# EasyEDA Pro project H7MS-H735-R4B.epro, board H7MS_CORE_H735_A1_核心板PCB
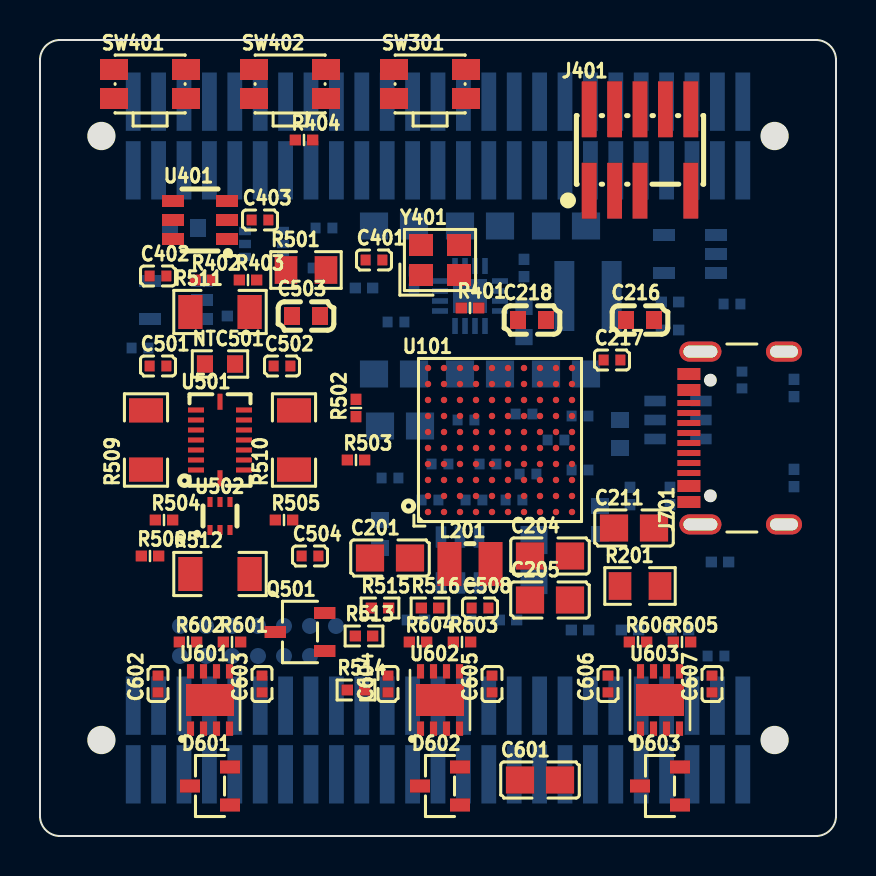
[diagram p11: board, top side]
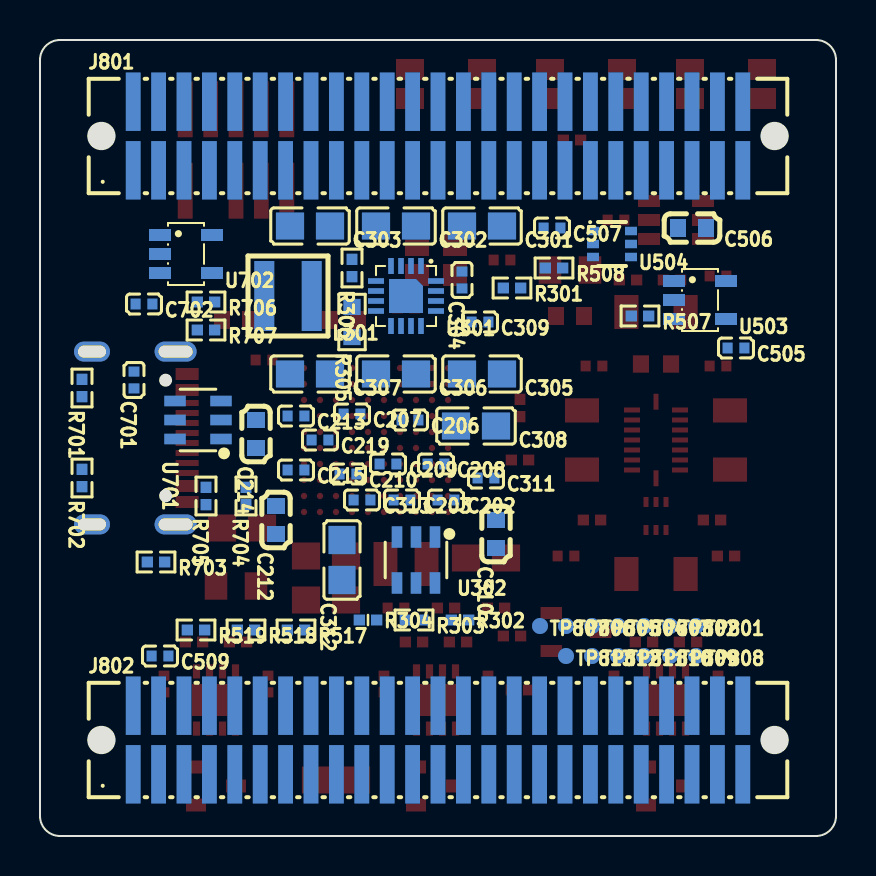
[diagram p12: board, bottom side, seen from below]

Outline 39.8 x 39.8 mm; copper layers: Top Layer, Inner1, Inner2, Inner3, Inner4, Bottom Layer. Coordinates in mm from the lower left corner of the outline.
Outline path: 0,38.8 arc(0.29,39.51) 1,39.8 38.8,39.8 arc(39.51,39.51) 39.8,38.8 39.8,1 arc(39.51,0.29) 38.8,0 1,0 arc(0.29,0.29) 0,1 0,38.8
Stack: Top Layer 0.035mm / Dielectric1 1.51mm FR4 er 4.5 / Bottom Layer 0.035mm

## Design rules (mm)
spacing copperThickness1oz (default): track to track 0.102, other pairs 0.152 to 0.3
spacing copperThickness2oz: track to track 0.203, other pairs 0.152 to 0.3
track width copperThickness1oz (default): min 0.127, default 0.152, max 2.54
track width copperThickness2oz: min 0.203, default 0.254, max 2.54
differential pair differentialPair (default): width min 0.127, default 0.254, max 2.54; gap min 0.152, default 0.152

## Placement (name value [footprint] x y rotation side)
C201  10uF  [C0805]  17.5 13.9 0 top
C202  100nF  [C0402]  19.5 16.8 0 bottom
C203  220pF  [C0402]  21.7 16.8 0 bottom
C204  10uF  [C0805]  25.5 14 0 top
C205  10uF  [C0805]  25.5 11.8 0 top
C206  100nF  [C0402]  21.3 20.8 0 bottom
C207  100nF  [C0402]  24.2 21.1 0 bottom
C208  100nF  [C0402]  20 18.6 0 bottom
C209  100nF  [C0402]  22.4 18.6 0 bottom
C210  100nF  [C0402]  24.4 18.1 0 bottom
C211  10uF  [C0805]  29.7 15.4 0 top
C212  1uF  [C0603]  28 15.8 90 bottom
C213  100nF  [C0402]  27 21 0 bottom
C214  1uF  [C0603]  29 20.1 90 bottom
C215  100nF  [C0402]  27 18.3 0 bottom
C216  1uF  [C0603]  30 25.8 0 top
C217  100nF  [C0402]  28.6 23.8 0 top
C218  1uF  [C0603]  24.6 25.8 0 top
C219  100nF  [C0402]  25.8 19.8 0 bottom
C301  10uF  [C0805]  17.7 30.5 0 bottom
C302  10uF  [C0805]  22 30.5 0 bottom
C303  10uF  [C0805]  26.3 30.5 0 bottom
C304  100nF  [C0402]  18.7 27.8 90 bottom
C305  10uF  [C0805]  17.7 23.1 0 bottom
C306  10uF  [C0805]  22 23.1 0 bottom
C307  10uF  [C0805]  26.3 23.1 0 bottom
C308  10uF  [C0805]  18 20.5 0 bottom
C309  10nF  [C0402]  17.8 25.7 0 bottom
C310  1uF  [C0603]  17 15.1 90 bottom
C311  100nF  [C0402]  17.5 17.9 0 bottom
C312  10uF  [C0805]  24.7 13.8 90 bottom
C313  100nF  [C0402]  23.7 16.8 0 bottom
C401  100nF  [C0402]  16.7 28.8 0 top
C402  100nF  [C0402]  5.9 28 0 top
C403  100nF  [C0402]  11 30.8 0 top
C501  100nF  [C0402]  5.9 23.5 0 top
C502  100nF  [C0402]  12.1 23.5 0 top
C503  1uF  [C0603]  13.3 26 0 top
C504  100nF  [C0402]  13.5 14 0 top
C505  100nF  [C0402]  5 24.4 0 bottom
C506  1uF  [C0603]  7.2 30.4 0 bottom
C507  100nF  [C0402]  14.2 30.4 0 bottom
C508  10nF  [C0402]  22 11.4 0 top
C509  10nF  [C0402]  33.8 9 0 bottom
C601  10uF  [C0805]  25 2.8 0 top
C602  100nF  [C0402]  5.9 7.6 90 top
C603  100nF  [C0402]  11.1 7.6 90 top
C604  100nF  [C0402]  17.4 7.6 90 top
C605  100nF  [C0402]  22.6 7.6 90 top
C606  100nF  [C0402]  28.4 7.6 90 top
C607  100nF  [C0402]  33.6 7.6 90 top
C701  100nF  [C0402]  35.1 22.8 90 bottom
C702  100nF  [C0402]  34.6 26.6 0 bottom
D601  PESD2CANFD24V-TR  [SOT-23-3_L2.9-W1.3-P1.90-LS2.4-BR]  8.5 2.5 0 top
D602  PESD2CANFD24V-TR  [SOT-23-3_L2.9-W1.3-P1.90-LS2.4-BR]  20 2.5 0 top
D603  PESD2CANFD24V-TR  [SOT-23-3_L2.9-W1.3-P1.90-LS2.4-BR]  31 2.5 0 top
J401  FTSH-105-01-L-DV-007-K  [HDR-SMD_9P-P1.27_FTSH-105-01-L-DV-007-K]  30 34.3 0 top
J701  USB4145-03-0070-C  [H7MS_USB4105_GF_A_120_B4_R3]  32.44 19.9 90 top
J801  TFM-115-02-L-D-A  [CONN-SMD_50P-P1.27_TFM-125-02-L-D-A]  19.9 35 180 bottom
J802  TFM-115-02-L-D-A  [CONN-SMD_50P-P1.27_TFM-125-02-L-D-A]  19.9 4.8 180 bottom
L201  2.2uH  [IND-SMD_L2.5-W2.0-1]  21.5 13.6 0 top
L301  2.2uH  [IND-SMD_L4.0-W4.0_XAL4030-332MEC]  27.4 27 0 bottom
NTC501  NTCG163JF103FT1  [R0603]  9 23.6 0 top
Q501  DMN2056U-7  [SOT-23-3_L2.9-W1.6-P1.90-LS2.8-BR]  13 10.2 0 top
R201  0Ω  [R0805]  30 12.5 0 top
R301  100kΩ  [R0402]  16.2 27.4 0 bottom
R302  10kΩ  [R0402]  18.8 10.8 0 bottom
R303  45.3kΩ  [R0402]  21.1 10.8 0 bottom
R304  10kΩ  [R0402]  23.4 10.8 0 bottom
R305  312kΩ  [R0603]  24.2 25.7 90 bottom
R306  100kΩ  [R0402]  24.2 28.4 90 bottom
R401  22Ω  [R0402]  21.5 26.4 0 top
R402  10kΩ  [R0402]  8.2 27.8 0 top
R403  10kΩ  [R0402]  10.4 27.8 0 top
R404  10kΩ  [R0402]  13.2 34.8 0 top
R501  0Ω  [R0805]  13.3 28.3 0 top
R502  22Ω  [R0402]  15.8 21.4 90 top
R503  22Ω  [R0402]  15.8 18.8 0 top
R504  10kΩ  [R0402]  6.2 15.8 0 top
R505  10kΩ  [R0402]  12.2 15.8 0 top
R506  10kΩ  [R0402]  5.5 14 0 top
R507  100kΩ  [R0402]  9.8 26 0 bottom
R508  1kΩ  [R0402]  14.1 28.4 0 bottom
R509  200Ω  [R1206]  5.3 19.8 90 top
R510  200Ω  [R1206]  12.7 19.8 90 top
R511  200Ω  [R1206]  9 26.2 0 top
R512  200Ω  [R1206]  9 13.1 0 top
R513  100Ω  [R0402]  16.2 10 0 top
R514  100kΩ  [R0402]  15.8 7.3 0 top
R515  10kΩ  [R0402]  17 11.4 0 top
R516  1kΩ  [R0402]  19.5 11.4 0 top
R517  20kΩ  [R0402]  27 10.3 0 bottom
R518  10kΩ  [R0402]  29.5 10.3 0 bottom
R519  1kΩ  [R0402]  32 10.3 0 bottom
R601  10kΩ  [R0402]  9.6 9.7 0 top
R602  10kΩ  [R0402]  7.4 9.7 0 top
R603  10kΩ  [R0402]  21.1 9.7 0 top
R604  10kΩ  [R0402]  18.9 9.7 0 top
R605  10kΩ  [R0402]  32.1 9.7 0 top
R606  10kΩ  [R0402]  29.9 9.7 0 top
R701  5.1kΩ  [R0402]  37.7 22.4 90 bottom
R702  5.1kΩ  [R0402]  37.7 17.9 90 bottom
R703  0Ω  [R0402]  34 13.7 0 bottom
R704  0Ω  [R0402]  29.5 17 90 bottom
R705  0Ω  [R0402]  31.5 17 90 bottom
R706  1kΩ  [R0402]  31.5 26.7 0 bottom
R707  100kΩ  [R0402]  31.5 25.3 0 bottom
SW301  EVQP7A01P  [H7MS_EVQP7A01P_1234]  19.5 37.6 0 top
SW401  EVQP7A01P  [H7MS_EVQP7A01P_1234]  5.5 37.6 0 top
SW402  EVQP7A01P  [H7MS_EVQP7A01P_1234]  12.5 37.6 0 top
TP801  PCB_TP_0.8  [H7MS_TP_0p8_NOMASKPASTE]  7 10.5 0 bottom
TP802  PCB_TP_0.8  [H7MS_TP_0p8_NOMASKPASTE]  8.3 10.5 0 bottom
TP803  PCB_TP_0.8  [H7MS_TP_0p8_NOMASKPASTE]  9.6 10.5 0 bottom
TP804  PCB_TP_0.8  [H7MS_TP_0p8_NOMASKPASTE]  10.9 10.5 0 bottom
TP805  PCB_TP_0.8  [H7MS_TP_0p8_NOMASKPASTE]  12.2 10.5 0 bottom
TP806  PCB_TP_0.8  [H7MS_TP_0p8_NOMASKPASTE]  13.5 10.5 0 bottom
TP807  PCB_TP_0.8  [H7MS_TP_0p8_NOMASKPASTE]  14.8 10.5 0 bottom
TP808  PCB_TP_0.8  [H7MS_TP_0p8_NOMASKPASTE]  7 9 0 bottom
TP809  PCB_TP_0.8  [H7MS_TP_0p8_NOMASKPASTE]  8.3 9 0 bottom
TP810  PCB_TP_0.8  [H7MS_TP_0p8_NOMASKPASTE]  9.6 9 0 bottom
TP811  PCB_TP_0.8  [H7MS_TP_0p8_NOMASKPASTE]  10.9 9 0 bottom
TP812  PCB_TP_0.8  [H7MS_TP_0p8_NOMASKPASTE]  12.2 9 0 bottom
TP813  PCB_TP_0.8  [H7MS_TP_0p8_NOMASKPASTE]  13.5 9 0 bottom
U101  STM32H735VGH6  [BGA-100_L8.0-W8.0-P0.80-R10-C10-BL]  23 19.8 0 top
U301  TPS62130ARGTR  [VQFN-16_L3.0-W3.0-P0.50-BL-EP1.7]  21.5 27 0 bottom
U302  TPS2553DBVR-1  [SOT-23-6_L2.9-W1.6-P0.95-LS2.8-BL]  21 13.8 0 bottom
U401  TPS3808G33DBVR  [SOT-23-6_L2.9-W1.6-P0.95-LS2.8-BR]  8 30.8 0 top
U501  BMI088  [LGA-16_L4.5-W3.0-P0.50-BL]  9 19.8 0 top
U502  TMP302ADRLR  [SOT-5X3-6_W1.6-L1.2-P0.50-LS1.6-BL]  9 16 0 top
U503  SN74LVC1G08DBVR  [SOT-23-5_L3.0-W1.7-P0.95-LS2.8-BR]  6.8 26.8 0 bottom
U504  TPS22919DCKR  [SC-70-6_L2.2-W1.3-P0.65-LS2.1-BR]  11.2 29.6 0 bottom
U601  TCAN1042HGVDRBRQ1  [HVSON-8_L3.0-W3.0-P0.65-BL-EP]  8.5 6.8 0 top
U602  TCAN1042HGVDRBRQ1  [HVSON-8_L3.0-W3.0-P0.65-BL-EP]  20 6.8 0 top
U603  TCAN1042HGVDRBRQ1  [HVSON-8_L3.0-W3.0-P0.65-BL-EP]  31 6.8 0 top
U701  USBLC6-2SC6  [SOT-23-6_L2.9-W1.6-P0.95-LS2.8-BL]  31.9 20.8 90 bottom
U702  SN74LVC1G17DBVR  [SOT-23-5_L3.0-W1.7-P0.95-LS2.8-BR]  32.5 29.1 0 bottom
Y401  X1G0041710015  [OSC-SMD_4P-L2.5-W2.0-BL]  20 28.8 0 top

## Footprints (pads in the part's own frame, mm; a bottom-side part is the same pattern mirrored in y, then rotated)
BGA-100_L8.0-W8.0-P0.80-R10-C10-BL
  round 0.32 smd: A1(-3.6,-3.6) A2(-3.6,-2.8) A3(-3.6,-2) A4(-3.6,-1.2) A5(-3.6,-0.4) A6(-3.6,0.4) A7(-3.6,1.2) A8(-3.6,2) A9(-3.6,2.8) A10(-3.6,3.6) B1(-2.8,-3.6) B2(-2.8,-2.8) B3(-2.8,-2) B4(-2.8,-1.2) B5(-2.8,-0.4) B6(-2.8,0.4) B7(-2.8,1.2) B8(-2.8,2) B9(-2.8,2.8) B10(-2.8,3.6) C1(-2,-3.6) C2(-2,-2.8) C3(-2,-2) C4(-2,-1.2) C5(-2,-0.4) C6(-2,0.4) C7(-2,1.2) C8(-2,2) C9(-2,2.8) C10(-2,3.6) D1(-1.2,-3.6) D2(-1.2,-2.8) D3(-1.2,-2) D4(-1.2,-1.2) D5(-1.2,-0.4) D6(-1.2,0.4) D7(-1.2,1.2) D8(-1.2,2) D9(-1.2,2.8) D10(-1.2,3.6) E1(-0.4,-3.6) E2(-0.4,-2.8) E3(-0.4,-2) E4(-0.4,-1.2) E5(-0.4,-0.4) E6(-0.4,0.4) E7(-0.4,1.2) E8(-0.4,2) E9(-0.4,2.8) E10(-0.4,3.6) F1(0.4,-3.6) F2(0.4,-2.8) F3(0.4,-2) F4(0.4,-1.2) F5(0.4,-0.4) F6(0.4,0.4) F7(0.4,1.2) F8(0.4,2) F9(0.4,2.8) F10(0.4,3.6) G1(1.2,-3.6) G2(1.2,-2.8) G3(1.2,-2) G4(1.2,-1.2) G5(1.2,-0.4) G6(1.2,0.4) G7(1.2,1.2) G8(1.2,2) G9(1.2,2.8) G10(1.2,3.6) H1(2,-3.6) H2(2,-2.8) H3(2,-2) H4(2,-1.2) H5(2,-0.4) H6(2,0.4) H7(2,1.2) H8(2,2) H9(2,2.8) H10(2,3.6) J1(2.8,-3.6) J2(2.8,-2.8) J3(2.8,-2) J4(2.8,-1.2) J5(2.8,-0.4) J6(2.8,0.4) J7(2.8,1.2) J8(2.8,2) J9(2.8,2.8) J10(2.8,3.6) K1(3.6,-3.6) K2(3.6,-2.8) K3(3.6,-2) K4(3.6,-1.2) K5(3.6,-0.4) K6(3.6,0.4) K7(3.6,1.2) K8(3.6,2) K9(3.6,2.8) K10(3.6,3.6)
C0402
  rect 0.5x0.54 smd: 1(-0.42,0) 2(0.42,0)
C0603
  rect 0.8x0.9 smd: 1(-0.7,0) 2(0.7,0)
C0805
  rect 1.41x1.35 smd: 1(-1,0) 2(1,0)
CONN-SMD_50P-P1.27_TFM-125-02-L-D-A
  rect 0.74x2.92 smd: 1(-15.24,-1.715) 2(-15.24,1.715) 3(-13.97,-1.715) 4(-13.97,1.715) 5(-12.7,-1.715) 6(-12.7,1.715) 7(-11.43,-1.715) 8(-11.43,1.715) 9(-10.16,-1.715) 10(-10.16,1.715) 11(-8.89,-1.715) 12(-8.89,1.715) 13(-7.62,-1.715) 14(-7.62,1.715) 15(-6.35,-1.715) 16(-6.35,1.715) 17(-5.08,-1.715) 18(-5.08,1.715) 19(-3.81,-1.715) 20(-3.81,1.715) 21(-2.54,-1.715) 22(-2.54,1.715) 23(-1.27,-1.715) 24(-1.27,1.715) 25(0,-1.715) 26(0,1.715) 27(1.27,-1.715) 28(1.27,1.715) 29(2.54,-1.715) 30(2.54,1.715) 31(3.81,-1.715) 32(3.81,1.715) 33(5.08,-1.715) 34(5.08,1.715) 35(6.35,-1.715) 36(6.35,1.715) 37(7.62,-1.715) 38(7.62,1.715) 39(8.89,-1.715) 40(8.89,1.715) 41(10.16,-1.715) 42(10.16,1.715) 43(11.43,-1.715) 44(11.43,1.715) 45(12.7,-1.715) 46(12.7,1.715) 47(13.97,-1.715) 48(13.97,1.715) 49(15.24,-1.715) 50(15.24,1.715)
H7MS_EVQP7A01P_1234
  rect 1.4x1.05 smd: 1(-1.8,0.725) 2(-1.8,-0.725) 3(1.8,0.725) 4(1.8,-0.725)
H7MS_TP_0p8_NOMASKPASTE
  round 0.8 smd: 1(0,0)
H7MS_USB4105_GF_A_120_B4_R3
  oval 1x2.1 hole 0.6x1.7: 1(-4.32,-0.575) 4(4.32,-0.575)
  oval 1x1.8 hole 0.6x1.4: 2(-4.32,-4.755) 3(4.32,-4.755)
  rect 0.6x1.15 smd: A1-B12(-3.2,0) A4-B9(-2.4,0) B1-A12(3.2,0) B4-A9(2.4,0)
  rect 0.3x1.15 smd: A5(-1.25,0) A6(-0.25,0) A7(0.25,0) A8(1.75,0) B5(1.25,0) B6(0.75,0) B7(-0.75,0) B8(-1.75,0)
HDR-SMD_9P-P1.27_FTSH-105-01-L-DV-007-K
  rect 0.74x2.79 smd: 1(-2.54,-2.035) 2(-2.54,2.035) 3(-1.27,-2.035) 4(-1.27,2.035) 5(0,-2.035) 6(0,2.035) 8(1.27,2.035) 9(2.54,-2.035) 10(2.54,2.035)
HVSON-8_L3.0-W3.0-P0.65-BL-EP
  rect 0.355x0.711 smd: 1(-0.975,-1.433) 2(-0.325,-1.433) 3(0.325,-1.433) 4(0.975,-1.433) 5(0.975,1.433) 6(0.325,1.433) 7(-0.325,1.433) 8(-0.975,1.433)
  rect 2.4x1.6 smd: 9(0,0)
IND-SMD_L2.5-W2.0-1
  rect 1.2x2.2 smd: 1(1.028,0) 2(-1.028,0)
IND-SMD_L4.0-W4.0_XAL4030-332MEC
  rect 1x3.5 smd: 1(-1.185,0) 2(1.185,0)
LGA-16_L4.5-W3.0-P0.50-BL
  rect 0.8x0.25 smd: 1(-1.2,-1.498) 2(-1.2,-0.998) 3(-1.2,-0.498) 4(-1.2,0.002) 5(-1.2,0.502) 6(-1.2,1.002) 7(-1.2,1.502) 9(1.2,1.502) 10(1.2,1.002) 11(1.2,0.502) 12(1.2,0.002) 13(1.2,-0.498) 14(1.2,-0.998) 15(1.2,-1.498)
  rect 0.25x0.8 smd: 8(0,1.915) 16(0,-1.915)
OSC-SMD_4P-L2.5-W2.0-BL
  rect 1.2x1.1 smd: 1(-0.95,-0.75) 2(0.95,-0.75) 3(0.95,0.75) 4(-0.95,0.75)
R0402
  rect 0.566x0.54 smd: 1(-0.433,0) 2(0.433,0)
R0603
  rect 0.806x0.864 smd: 1(-0.753,0) 2(0.753,0)
R0805
  rect 1.133x1.377 smd: 1(-1,0) 2(1,0)
R1206
  rect 1.208x1.701 smd: 1(-1.479,0) 2(1.479,0)
SC-70-6_L2.2-W1.3-P0.65-LS2.1-BR
  rect 0.6x0.42 smd: 1(0.95,-0.65) 2(0.95,0) 3(0.95,0.65) 4(-0.95,0.65) 5(-0.95,0) 6(-0.95,-0.65)
SOT-5X3-6_W1.6-L1.2-P0.50-LS1.6-BL
  rect 0.25x0.5 smd: 1(-0.501,-0.7) 2(-0.001,-0.7) 3(0.499,-0.7) 4(0.501,0.7) 5(-0.001,0.7) 6(-0.501,0.7)
SOT-23-3_L2.9-W1.3-P1.90-LS2.4-BR
  rect 1x0.65 smd: 1(1,-0.95) 2(1,0.95) 3(-1,0)
SOT-23-3_L2.9-W1.6-P1.90-LS2.8-BR
  rect 1.07x0.6 smd: 1(1.235,-0.95) 2(1.235,0.95) 3(-1.235,0)
SOT-23-5_L3.0-W1.7-P0.95-LS2.8-BR
  rect 1.1x0.6 smd: 1(1.3,-0.95) 2(1.3,0) 3(1.3,0.95) 4(-1.3,0.95) 5(-1.3,-0.95)
SOT-23-6_L2.9-W1.6-P0.95-LS2.8-BL
  rect 0.532x1.072 smd: 1(-0.95,-1.149) 2(0,-1.149) 3(0.95,-1.149) 4(0.95,1.149) 5(0,1.149) 6(-0.95,1.149)
SOT-23-6_L2.9-W1.6-P0.95-LS2.8-BR
  rect 1.1x0.6 smd: 1(1.35,-0.95) 2(1.35,0) 3(1.35,0.95) 4(-1.35,0.95) 5(-1.35,0) 6(-1.35,-0.95)
VQFN-16_L3.0-W3.0-P0.50-BL-EP1.7
  rect 0.28x0.8 smd: 1(-0.749,-1.5) 2(-0.249,-1.5) 3(0.249,-1.5) 4(0.75,-1.5) 9(0.75,1.5) 10(0.249,1.5) 11(-0.249,1.5) 12(-0.749,1.5)
  rect 0.8x0.28 smd: 5(1.5,-0.749) 6(1.5,-0.249) 7(1.5,0.249) 8(1.5,0.75) 13(-1.5,0.75) 14(-1.5,0.249) 15(-1.5,-0.249) 16(-1.5,-0.749)
  custom 1.7x1.7 smd: 17(0,0)

## Nets
3V3_A: C212.1 C213.1 C214.1 C215.1 R201.2 R515.1 TP803.1 U101.H1 U101.J1
3V3_AUX: C312.1 C313.1 J801.22 J801.24 TP804.1 U302.6
3V3_D: C201.1 C202.1 C208.1 C209.1 C210.1 C211.1 C216.1 C217.1 C218.1 C219.1 C305.1 C306.1 C307.1 C308.1 C310.1 C311.1 C401.1 C402.1 C504.1 C505.1 C603.1 C605.1 C607.1 C702.1 J401.1 L301.2 R201.1 R301.2 R302.2 R304.2 R305.1 R402.2 R403.2 R501.1 R506.2 R601.2 R602.2 R603.2 R604.2 R605.2 R606.2 SW402.2 SW402.4 TP802.1 U101.C2 U101.D3 U101.D6 U101.E1 U101.E5 U101.E8 U101.F6 U301.14 U302.1 U401.5 U401.6 U502.4 U502.5 U502.6 U503.5 U601.5 U602.5 U603.5 U702.5 Y401.1 Y401.4
3V3_IMU: C501.1 C502.1 C503.1 R501.2 R504.2 R505.2 U501.3 U501.11
5V_IN: C301.1 C302.1 C303.1 C304.1 C506.1 C601.1 C602.1 C604.1 C606.1 J801.10 J801.12 J801.14 J801.16 J801.18 J801.20 R517.1 TP801.1 U301.10 U301.11 U301.12 U301.13 U504.1 U601.3 U602.3 U603.3
GND: C201.2 C202.2 C203.2 C204.2 C205.2 C206.2 C207.2 C208.2 C209.2 C210.2 C211.2 C212.2 C213.2 C214.2 C215.2 C216.2 C217.2 C218.2 C219.2 C301.2 C302.2 C303.2 C304.2 C305.2 C306.2 C307.2 C308.2 C309.2 C310.2 C311.2 C312.2 C313.2 C401.2 C402.2 C403.2 C501.2 C502.2 C503.2 C504.2 C505.2 C506.2 C507.2 C508.2 C509.2 C601.2 C602.2 C603.2 C604.2 C605.2 C606.2 C607.2 C701.2 C702.2 D601.3 D602.3 D603.3 J401.3 J401.5 J401.9 J701.A1-B12 J701.B1-A12 J801.3 J801.6 J801.9 J801.11 J801.13 J801.15 J801.17 J801.19 J801.21 J801.23 J801.25 J801.28 J801.31 J801.34 J801.37 J801.40 J801.43 J801.46 J801.49 J802.2 J802.5 J802.8 J802.11 J802.14 J802.17 J802.20 J802.23 J802.26 J802.29 J802.32 J802.35 J802.38 J802.41 J802.44 J802.47 J802.49 J802.50 NTC501.2 Q501.2 R303.2 R306.2 R404.2 R507.2 R514.2 R518.2 R701.2 R702.2 R703.2 R707.2 SW301.2 SW301.4 SW401.2 SW401.4 TP806.1 U101.C1 U101.D1 U101.D5 U101.E7 U101.F5 U101.H2 U301.6 U301.7 U301.8 U301.15 U301.16 U301.17 U302.2 U401.2 U501.2 U501.4 U501.6 U501.7 U502.1 U502.2 U503.3 U504.2 U601.2 U601.9 U602.2 U602.9 U603.2 U603.9 U701.2 U702.3 Y401.2
V5_NODE: R517.2 R518.1 R519.1
VBUS_PRESENT: U101.E9 U702.4
VBUS_SENSE: R706.2 R707.1 U702.2
AUX_EN: R302.1 SW301.1 SW301.3 U302.3
AUX_FAULT_N: R304.1 TP812.1 U302.4
AUX_ILIM: R303.1 U302.5
BOOT0: R404.1 SW402.1 SW402.3 TP808.1 U101.A5
BUCK_FB: R305.2 R306.1 U301.5
BUCK_PG: R301.1 TP813.1 U301.4
BUCK_SS: C309.1 U301.9
BUCK_SW: L301.1 U301.1 U301.2 U301.3
CAN1_H: D601.2 J801.1 U601.7
CAN1_L: D601.1 J801.2 U601.6
CAN1_RX: U101.A4 U601.4
CAN1_STB: R601.1 U101.A8 U601.8
CAN1_TX: R602.1 U101.E3 U601.1
CAN2_H: D602.2 J801.4 U602.7
CAN2_L: D602.1 J801.5 U602.6
CAN2_RX: U101.A6 U602.4
CAN2_STB: R603.1 U101.B7 U602.8
CAN2_TX: R604.1 U101.D4 U602.1
CAN3_H: D603.2 J801.7 U603.7
CAN3_L: D603.1 J801.8 U603.6
CAN3_RX: U101.H9 U603.4
CAN3_STB: R605.1 U101.C6 U603.8
CAN3_TX: R606.1 U101.H10 U603.1
EXP_PA0: J801.26 U101.G3
EXP_PA1: J801.27 U101.J2
EXP_PA2: J801.32 U101.H3
EXP_PA3: J801.33 U101.G5
EXP_PA4: J801.35 U101.K1
EXP_PA5: J801.36 U101.K2
EXP_PA6: J801.38 U101.J3
EXP_PA7: J801.39 U101.K3
EXP_PA8: J801.41 U101.F10
EXP_PA10: J801.29 U101.E10
EXP_PA15: J801.30 U101.C8
EXP_PB0: J801.42 U101.K4
EXP_PB1: J801.44 U101.K5
EXP_PB2: J802.4 U101.J5
EXP_PB3: J802.6 U101.B6
EXP_PB4: J802.7 U101.C5
EXP_PB7: J802.9 U101.B5
EXP_PB10: J801.45 U101.K7
EXP_PB11: J801.47 U101.J7
EXP_PB12: J801.48 U101.K8
EXP_PB13: J801.50 U101.J8
EXP_PB14: J802.1 U101.K9
EXP_PB15: J802.3 U101.K10
EXP_PC0: J802.10 U101.F3
EXP_PC1: J802.12 U101.F1
EXP_PC4: J802.18 U101.H4
EXP_PC5: J802.19 U101.J4
EXP_PC6: J802.21 U101.F8
EXP_PC7: J802.22 U101.G9
EXP_PC8: J802.24 U101.G10
EXP_PC9: J802.25 U101.F9
EXP_PC10: J802.13 U101.B10
EXP_PC11: J802.15 U101.B9
EXP_PC12: J802.16 U101.A10
EXP_PD0: J802.27 U101.C7
EXP_PD1: J802.28 U101.B8
EXP_PD2: J802.34 U101.A9
EXP_PD5: J802.36 U101.D7
EXP_PD6: J802.37 U101.A7
EXP_PD8: J802.39 U101.J9
EXP_PD9: J802.40 U101.H8
EXP_PD11: J802.30 U101.H7
EXP_PD14: J802.31 U101.G7
EXP_PD15: J802.33 U101.G8
EXP_PE0: J802.42 U101.B4
EXP_PE1: J802.43 U101.C4
EXP_PE7: J802.46 U101.H5
EXP_PE8: J802.48 U101.J6
EXP_PE10: J802.45 U101.H6
HEAT_5V: C507.1 R508.2 R509.1 R510.1 R511.1 R512.1 TP811.1 U504.6
HEAT_ALLOW: R507.1 TP810.1 U503.4 U504.3
HEAT_DRAIN: Q501.3 R509.2 R510.2 R511.2 R512.2
HEAT_GATE: Q501.1 R513.2 R514.1
HSE_IN: R401.2 U101.G1
HSE_OUT: R401.1 Y401.3
IMU_ACC_CS: R504.1 U101.B3 U501.14
IMU_ACC_IRQ: U101.E4 U501.16
IMU_GYRO_CS: R505.1 U101.C3 U501.5
IMU_GYRO_IRQ: U101.J10 U501.12
IMU_HEATER_NTC: C508.1 R516.2 U101.G4
IMU_HEATER_PWM: R513.1 U101.K6
IMU_MISO: U101.A2 U501.10 U501.15
IMU_MOSI: R503.1 U101.A1
IMU_MOSI_DEV: R503.2 U501.9
IMU_SCK: R502.1 U101.A3
IMU_SCK_DEV: R502.2 U501.8
LOCAL_5V_ADC: C509.1 R519.2 U101.F4
MR_N: R402.1 SW401.1 SW401.3 U401.3
NRST: C403.1 J401.10 R403.1 TP807.1 U101.F2 U401.1 U503.2
NTC_NODE: NTC501.1 R515.2 R516.1
SMPS_SW: C203.1 L201.1 U101.D2
SWCLK: J401.4 U101.C9
SWDIO: J401.2 U101.C10
TEMP_OK: R506.1 TP809.1 U502.3 U503.1
U_HEAT_POWER_QOD: R508.1 U504.5
USB_CC1: J701.A5 R701.1
USB_CC2: J701.B5 R702.1
USB_DM: R705.2 U101.D10
USB_DM_CONN: J701.A7 J701.B7 R705.1 U701.3 U701.4
USB_DP: R704.2 U101.D9
USB_DP_CONN: J701.A6 J701.B6 R704.1 U701.1 U701.6
USB_SHELL: J701.1 J701.2 J701.3 J701.4 R703.1
USB_VBUS: C701.1 J701.A4-B9 J701.B4-A9 R706.1 U701.5
VCORE: C204.1 C205.1 C206.1 C207.1 L201.2 TP805.1 U101.D8 U101.E2 U101.E6 U101.F7 U101.G6

Pads without a net: J401 6 8; J701 A8 B8; U101 B1 B2 G2; U401 4; U501 1 13; U504 4; U702 1
